# Altium schematic sheet PSOC_PERI_2.SchDoc
size A3; SheetNumber: 7; SheetTotal: 7
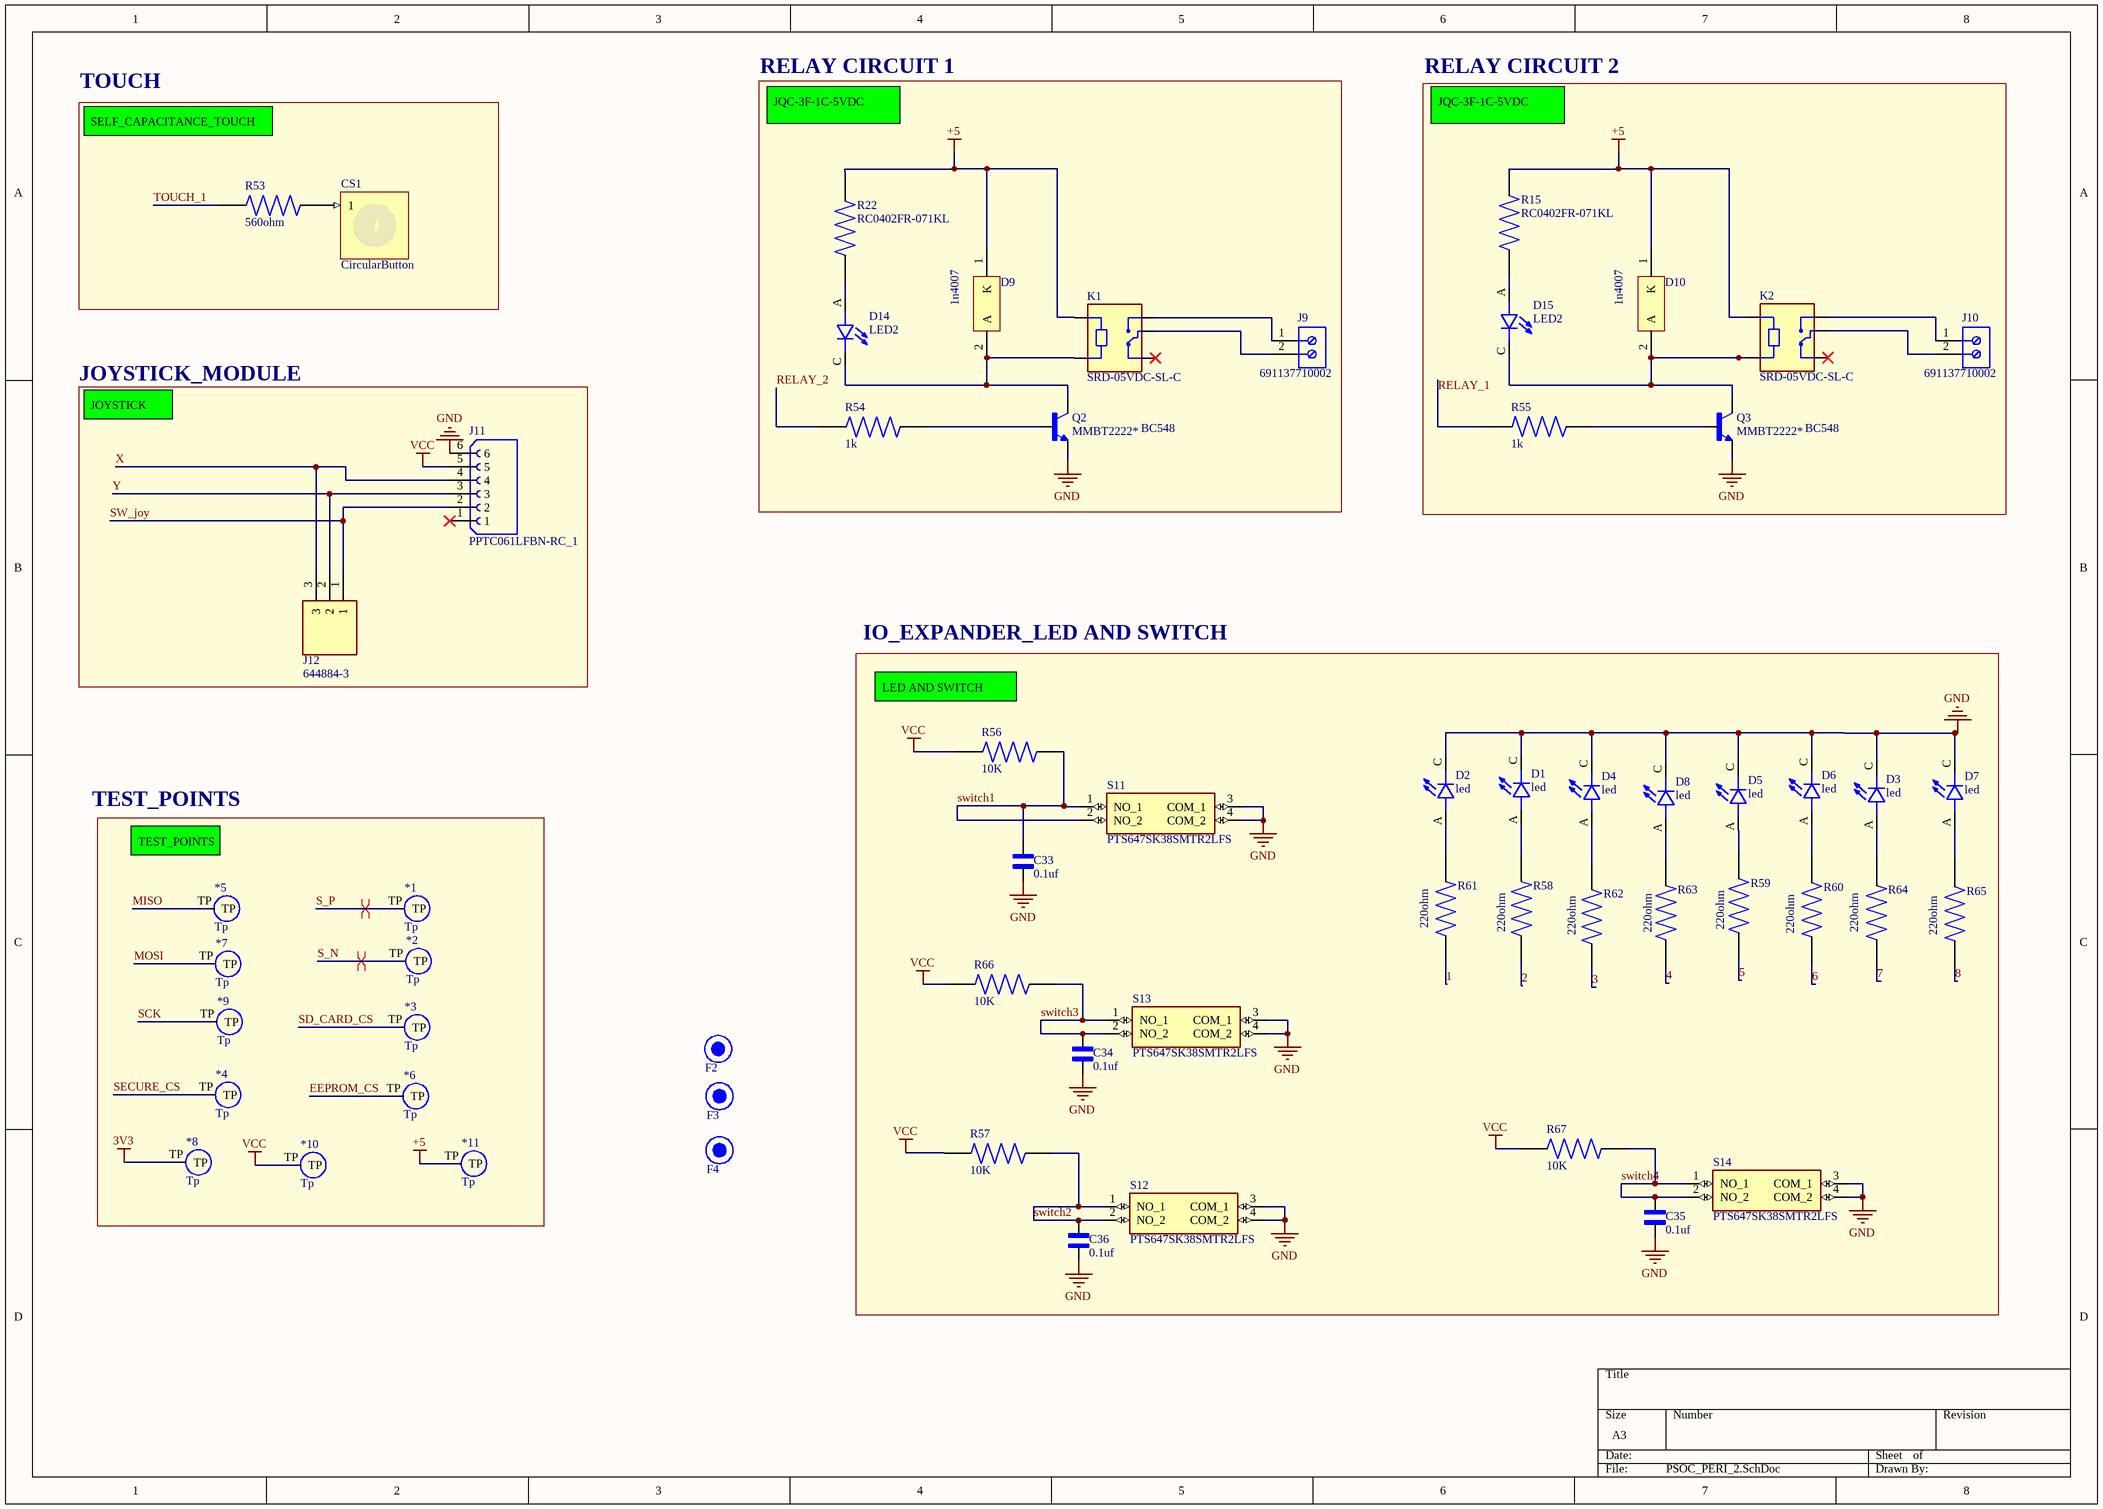
[diagram p0: PSOC_PERI_2.SchDoc]

## Parts
*1  Tp  [TP]
*2  Tp  [TP]
*3  Tp  [TP]
*4  Tp  [TP]
*5  Tp  [TP]
*6  Tp  [TP]
*7  Tp  [TP]
*8  Tp  [TP]
*9  Tp  [TP]
*10  Tp  [TP]
*11  Tp  [TP]
C33  0.1uf  [CAPC1005X55N]
C34  0.1uf  [CAPC1005X55N]
C35  0.1uf  [CAPC1005X55N]
C36  0.1uf  [CAPC1005X55N]
CS1  CircularButton  (no BOM)
D1  led  [LEDC2012X120N]
D2  led  [LEDC2012X120N]
D3  led  [LEDC2012X120N]
D4  led  [LEDC2012X120N]
D5  led  [LEDC2012X120N]
D6  led  [LEDC2012X120N]
D7  led  [LEDC2012X120N]
D8  led  [LEDC2012X120N]
D9  1n4007  [ONSC-AXIAL_LEAD-2-59-10_P]
D10  1n4007  [ONSC-AXIAL_LEAD-2-59-10_P]
D14  LED2  [LEDC2012X120N]
D15  LED2  [LEDC2012X120N]
F2  FIDUCIAL  [FIDUCIAL-1MM]  (value not drawn)
F3  FIDUCIAL  [FIDUCIAL-1MM]  (value not drawn)
F4  FIDUCIAL  [FIDUCIAL-1MM]  (value not drawn)
J9  691137710002  [691137710002]
J10  691137710002  [691137710002]
J11  PPTC061LFBN-RC_1  [SULLINS_PPTC061LFBN-RC]
J12  644884-3  [TE_644884-3]
K1  SRD-05VDC-SL-C  [RELAY_SRD-05VDC-SL-C]
K2  SRD-05VDC-SL-C  [RELAY_SRD-05VDC-SL-C]
Q2  MMBT2222*  [SOT23-BEC]
Q3  MMBT2222*  [SOT23-BEC]
R15  RC0402FR-071KL  [RESC1005X40N]
R22  RC0402FR-071KL  [RESC1005X40N]
R53  560ohm  [RESC1005X40N]
R54  1k  [RESC1005X40N]
R55  1k  [RESC1005X40N]
R56  10K  [RESC1005X40N]
R57  10K  [RESC1005X40N]
R58  220ohm  [RESC1005X40N]
R59  220ohm  [RESC1005X40N]
R60  220ohm  [RESC1005X40N]
R61  220ohm  [RESC1005X40N]
R62  220ohm  [RESC1005X40N]
R63  220ohm  [RESC1005X40N]
R64  220ohm  [RESC1005X40N]
R65  220ohm  [RESC1005X40N]
R66  10K  [RESC1005X40N]
R67  10K  [RESC1005X40N]
S11  PTS647SK38SMTR2LFS  [PTS647SK38SMTR2LFS]
S12  PTS647SK38SMTR2LFS  [PTS647SK38SMTR2LFS]
S13  PTS647SK38SMTR2LFS  [PTS647SK38SMTR2LFS]
S14  PTS647SK38SMTR2LFS  [PTS647SK38SMTR2LFS]

## Blocks framed on the sheet
TOUCH: CS1 R53
RELAY CIRCUIT 1: D9 D14 J9 K1 Q2 R22 R54
RELAY CIRCUIT 2: D10 D15 J10 K2 Q3 R15 R55
JOYSTICK_MODULE: J11 J12
IO_EXPANDER_LED AND SWITCH: C33-C36 D1-D8 R56-R67 S11-S14

## Nets
3V3: *8.TP
+5: *11.TP D9.1(K) D10.1(K) K1.A1 K2.A1 R15.2 R22.2
GND: C33.2 C34.2 C35.2 C36.2 D1.C D2.C D3.C D4.C D5.C D6.C D7.C D8.C J11.6 Q2.E Q3.E S11.3(COM_1) S11.4(COM_2) S12.3(COM_1) S12.4(COM_2) S13.3(COM_1) S13.4(COM_2) S14.3(COM_1) S14.4(COM_2)
VCC: *10.TP J11.5 R56.2 R57.2 R66.2 R67.2
1: R61.1
2: R58.1
3: R62.1
4: R63.1
5: R59.1
6: R60.1
7: R64.1
8: R65.1
EEPROM_CS: *6.TP
MISO: *5.TP
MOSI: *7.TP
RELAY_1: R55.2
RELAY_2: R54.2
S_N: *2.TP
S_P: *1.TP
SCK: *9.TP
SD_CARD_CS: *3.TP
SECURE_CS: *4.TP
SW_joy: J11.2 J12.1
switch1: C33.1 R56.1 S11.1(NO_1) S11.2(NO_2)
switch2: C36.1 R57.1 S12.1(NO_1) S12.2(NO_2)
switch3: C34.1 R66.1 S13.1(NO_1) S13.2(NO_2)
switch4: C35.1 R67.1 S14.1(NO_1) S14.2(NO_2)
TOUCH_1: R53.2
X: J11.4 J12.3
Y: J11.3 J12.2
NetCS1_1: CS1.1 R53.1
NetD1_A: D1.A R58.2
NetD2_A: D2.A R61.2
NetD3_A: D3.A R64.2
NetD4_A: D4.A R62.2
NetD5_A: D5.A R59.2
NetD6_A: D6.A R60.2
NetD7_A: D7.A R65.2
NetD8_A: D8.A R63.2
NetD9_2: D9.2(A) D14.C K1.A2 Q2.C
NetD10_2: D10.2(A) D15.C K2.A2 Q3.C
NetD14_A: D14.A R22.1
NetD15_A: D15.A R15.1
NetJ9_1: J9.1 K1.NO
NetJ9_2: J9.2 K1.COM
NetJ10_1: J10.1 K2.NO
NetJ10_2: J10.2 K2.COM
NetQ2_B: Q2.B R54.1
NetQ3_B: Q3.B R55.1

Not connected (* = marked no-connect by the designer): J11 1*; K1 NC*; K2 NC*

## Layout directives
differential pair: S_N, S_P

## Notes on the sheet
- SELF_CAPACITANCE_TOUCH
- JQC-3F-1C-5VDC
- JOYSTICK
- BC548
- (near R56) LED AND SWITCH
- TEST_POINTS
- Type @ to refer to a designator

## Library data of the parts
C33-C36 = C0402T104K4RACTU: Cap Ceramic 0.1uF 16V X7R 10% SMD 0402 85Â°C Punched Paper T/R; MF: KEMET; SnapEDA_Link: https://www.snapeda.com/parts/C0402T104K4RACTU/KEMET/view-part/?ref=snap; Package: 0402 KEMET; Value: *; MP: C0402T104K4RACTU; Check_prices: https://www.snapeda.com/parts/C0402T104K4RACTU/KEMET/view-part/?ref=eda
CS1 = CircularButton: ConfiguratorName: CYPRESS_TOUCH; ConfigurationParameters: {}__sensorid[CircularButton]{}outerDiameter[10]{}innerDiameter[1]{}
D1-D8 D14 D15 = SML-LXT0805IW-TR: LED;Red;11mcd;0.061In.Dia.;SMD;100mA;2V Vf;635nm;140deg;SMD;White Diffused;5V Vr | Lumex SML-LXT0805IW-TR; MF: Lumex Opto/Components; SnapEDA_Link: https://www.snapeda.com/parts/SML-LXT0805IW-TR/Lumex+Opto%252FComponents+Inc./view-part/?ref=snap; Package: 0805 Lumex; Value: *; MP: SML-LXT0805IW-TR; Check_prices: https://www.snapeda.com/parts/SML-LXT0805IW-TR/Lumex+Opto%252FComponents+Inc./view-part/?ref=eda
D9 D10 = CMP-0902-00143-1: Standard Recovery Rectifier, 2-Pin Axial_Lead, Pb-Free, Bulk Bag; PartNumber: 1N4007G; Manufacturer: On Semiconductor; VRRM Max (V): 1000; IFSM Max (A): 30; IO(rec) Max (A): 1; ComponentLink2Description: Datasheet; ComponentLink2URL: http://www.onsemi.com/pub_link/Collateral/1N4001-D.PDF; PackageDescription: 2-Pin, Axial Lead, Diameter 2.35 mm; ComponentLink1URL: http://www.onsemi.com/; ComponentLink3URL: http://www.onsemi.cn/pub_link/Collateral/59-10.PDF; PackageReference: AXIAL_LEAD-2-59-10; ComponentLink1Description: Manufacturer URL; Mounting Technology: Through Hole; ComponentLink3Description: Package Specification; Packing: Bulk Bag; PackageVersion: Rev. U, 02/2005; DatasheetVersion: Rev. 13; RoHS: TRUE; Type: Standard Recovery
J9 J10 = CMP-1502-03324-2: NexarPartId: 78871135; Voltage Rating: 300V; Number of Contacts: 2; Current Rating: 16A; Lead Pitch: 5mm; Height: 11.6mm; Packaging: Box; RoHS: Non-Compliant; Contact Material: Nickel, Tin; Max Operating Temperature: 120°C; Number of Pins: 2; Min Operating Temperature: -30°C; Number of Rows: 1
J11 = CMP-002-00228-1: 6 Position Header Connector 0.100 (2.54mm) Through Hole Tin; MF: Sullins Connector; MP: PPTC061LFBN-RC; Value: *; Pins: 6; Design Item ID: PPTC061LFBN-RC_1; SnapEDA_Link: https://www.snapeda.com/parts/PPTC061LFBN-RC/Sullins+Connector+Solutions/view-part/?ref=snap; Component Type: Standard; Check_prices: https://www.snapeda.com/parts/PPTC061LFBN-RC/Sullins+Connector+Solutions/view-part/?ref=eda; Source: Maze_Solver_2_Layer.SCHLIB; Case/Package: None
J12 = 644884-3: Conn Unshrouded Header HDR 3 POS 2.54mm Solder ST Thru-Hole Bag/Box; MF: TE Connectivity; SnapEDA_Link: https://www.snapeda.com/parts/644884-3/TE+Connectivity+AMP+Connectors/view-part/?ref=snap; Package: None; Value: *; MP: 644884-3; EU_RoHS_Compliance: Compliant; Check_prices: https://www.snapeda.com/parts/644884-3/TE+Connectivity+AMP+Connectors/view-part/?ref=eda
K1 K2 = SRD-05VDC-SL-C: 5V Trigger Relay Module For Arduino And Raspberry Pi 5V Trigger Relay Module For Arduino And Raspberry Pi; MF: Songle Relay; Check_prices: https://www.snapeda.com/parts/SRD-05VDC-SL-C/Songle+Relay/view-part/?ref=eda; Value: *; Availability: Not in stock; Price: None; Package: NON STANDARD-5 Songle Relay; MP: SRD-05VDC-SL-C; SnapEDA_Link: https://www.snapeda.com/parts/SRD-05VDC-SL-C/Songle+Relay/view-part/?ref=snap
Q2 Q3 = MMBT2222*: Bipolar (BJT) Transistor NPN 30 V 600 mA 250MHz 300 mW Surface Mount SOT-23-3 (TO-236); MF: ON Semiconductor; SnapEDA_Link: https://www.snapeda.com/parts/MMBT2222/Onsemi/view-part/?ref=snap; Package: SOT-23-3 Fairchild Semiconductor; Value: *; MP: MMBT2222; Check_prices: https://www.snapeda.com/parts/MMBT2222/Onsemi/view-part/?ref=eda
R15 R22 = RC0402FR-071KL: 1 kOhms Â±1% 0.063W, 1/16W Chip Resistor 0402 (1005 Metric) Moisture Resistant Thick Film; MF: Yageo Corporation; MP: RC0402FR071KL; SnapEDA_Link: https://www.snapeda.com/parts/RC0402FR071KL/Yageo/view-part/?ref=snap; Package: 0402-2 YAGEO; Value: *; Check_prices: https://www.snapeda.com/parts/RC0402FR071KL/Yageo/view-part/?ref=eda
R53-R67 = RL0402FR-070R1L: 100 mOhms Â±1% 0.063W, 1/16W Chip Resistor 0402 (1005 Metric) Automotive AEC-Q200, Current Sense, Moisture Resistant Thick Film; MF: Yageo; SnapEDA_Link: https://www.snapeda.com/parts/RL0402FR-070R1L/Yageo/view-part/?ref=snap; Package: 0402-2 Yageo; Value: *; MP: RL0402FR-070R1L; Check_prices: https://www.snapeda.com/parts/RL0402FR-070R1L/Yageo/view-part/?ref=eda
S11-S14 = PTS647SK38SMTR2LFS: Tactile Switch SPST-NO Top Actuated Surface Mount; MF: C&K; SnapEDA_Link: https://www.snapeda.com/parts/PTS%20647%20SK38%20SMTR2%20LFS/C%2526K/view-part/?ref=snap; Package: None; Value: *; MP: PTS 647 SK38 SMTR2 LFS; Check_prices: https://www.snapeda.com/parts/PTS%20647%20SK38%20SMTR2%20LFS/C%2526K/view-part/?ref=eda